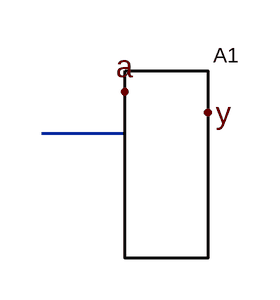
[diagram p0: schematic adevice_open_pin_loose_wire.asc]
adevice_open_pin_loose_wire.asc, the LTspice schematic file:
Version 4
SHEET 1 880 680
WIRE 0 96 64 96
FLAG 64 64 a
FLAG 128 80 y
SYMBOL a8 96 64 R0
SYMATTR InstName A1

The netlist it stands for:
* adevice_open_pin_loose_wire.asc
A1 a 0 N001 0 0 0 y 0 AND
.backanno
.end